# Altium schematic sheet Connections.SchDoc
size A; SheetNumber: 1; SheetTotal: 5
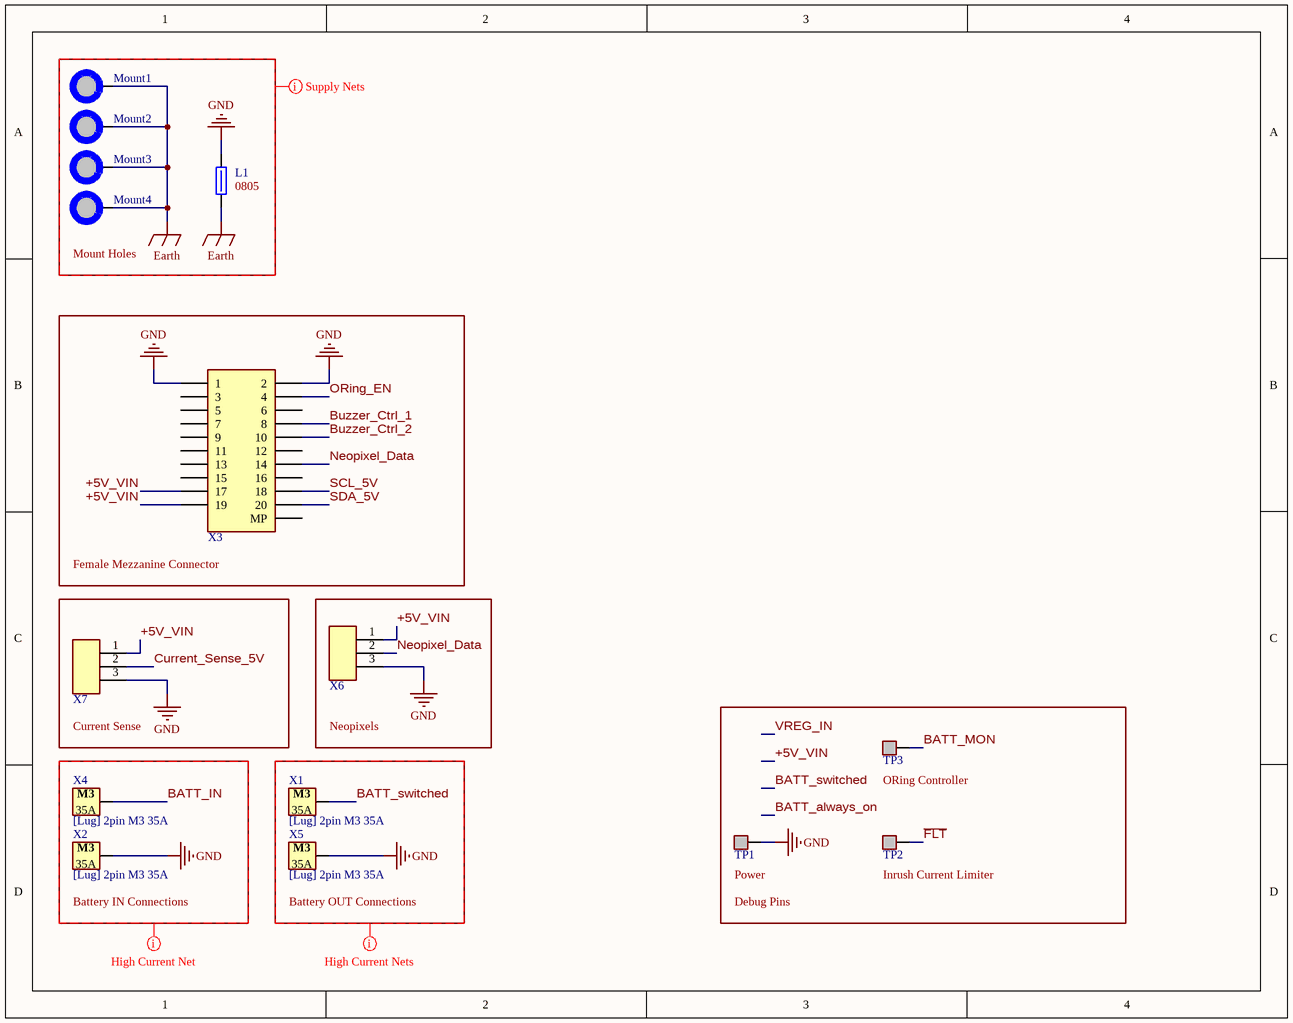
[diagram p0: Connections.SchDoc]

## Parts
L1  Size Package: 0805  [[Ferrite] SMD 0805]  (hidden comment: 652-MH2029-300Y)
Mount1  M3 Mount Hole  [[Mount] M3 Mount Hole]  (value not drawn)  (no BOM)
Mount2  M3 Mount Hole  [[Mount] M3 Mount Hole]  (value not drawn)  (no BOM)
Mount3  M3 Mount Hole  [[Mount] M3 Mount Hole]  (value not drawn)  (no BOM)
Mount4  M3 Mount Hole  [[Mount] M3 Mount Hole]  (value not drawn)  (no BOM)
TP1  [THM] Thru-Hole  [[THM] White]  (value not drawn)
TP2  [THM] Thru-Hole  [[THM] White]  (value not drawn)
TP3  [THM] Thru-Hole  [[THM] White]  (value not drawn)
X1  [Lug] 2pin M3 35A  [[Lug] 2pin M3 35A]
X2  [Lug] 2pin M3 35A  [[Lug] 2pin M3 35A]
X3  [Mezzanine] 20pin 0.4mm Female  [[Mezzanine] 20pin 0.4mm Female]  (value not drawn)
X4  [Lug] 2pin M3 35A  [[Lug] 2pin M3 35A]
X5  [Lug] 2pin M3 35A  [[Lug] 2pin M3 35A]
X6  [Sherlock] 3pin 90deg  [[Sherlock] 3pin 90deg]  (value not drawn)
X7  [Sherlock] 3pin 90deg  [[Sherlock] 3pin 90deg]  (value not drawn)

## Blocks framed on the sheet
Mount Holes: L1 Mount1-Mount4
Female Mezzanine Connector: X3
Current Sense: X7
Neopixels: X6
Battery IN Connections: X2 X4
Battery OUT Connections: X1 X5

## Nets
Earth: L1.1 Mount1.1 Mount2.1 Mount3.1 Mount4.1
GND: L1.2 TP1.1 X2.1 X3.1 X3.2 X5.1 X6.3 X7.3
+5V_VIN: X3.17 X3.19 X6.1 X7.1
~{FLT}: TP2.1
BATT_IN: X4.1
BATT_MON: TP3.1
BATT_switched: X1.1
Buzzer_Ctrl_1: X3.8
Buzzer_Ctrl_2: X3.10
Current_Sense_5V: X7.2
Neopixel_Data: X3.14 X6.2
ORing_EN: X3.4
SCL_5V: X3.18
SDA_5V: X3.20

Not connected (* = marked no-connect by the designer): X3 3 5 6 7 9 11 12 13 15 16 MP

## Layout directives
net class Supply_Nets: Earth, GND
net class High_Current_Nets: BATT_IN, BATT_switched, GND

## Notes on the sheet
- (near TP3) ORing Controller
- Debug Pins
- (near TP1) Power
- (near TP2) Inrush Current Limiter
- (in symbol [Lug] 2pin M3 35A) M3; 35A

## Library data of the parts
L1 = [Ferrite] SMD 0805 3A 30ohm: Res @ Freq: 30 @ 100MHz; Supplier 1: DigiKey; Supplier Part Number 1: MH2029-300YCT-ND
Mount1-Mount4 = [Mount] M3 Mount Hole: Place at least 4.5mm from board edge. Plated.
TP1-TP3 = [THM] Thru-Hole: 5012; Supplier 1: DigiKey; Supplier Part Number 1: 36-5012-ND
X1 X2 X4 X5 = [Lug] 2pin M3 35A: AMT0230003TH0000G; Supplier 1: DigiKey; Supplier Part Number 1: 1818-AMT0230003TH0000G-ND
X3 = [Mezzanine] 20pin 0.4mm Female: DF40C-20DP-0.4V(51); System: Connector; Supplier 1: DigiKey; Supplier Part Number 1: H11618CT-ND
X6 X7 = [Sherlock] 3pin 90deg: 0353630360; Supplier 1: DigiKey; Supplier Part Number 1: WM18932-ND